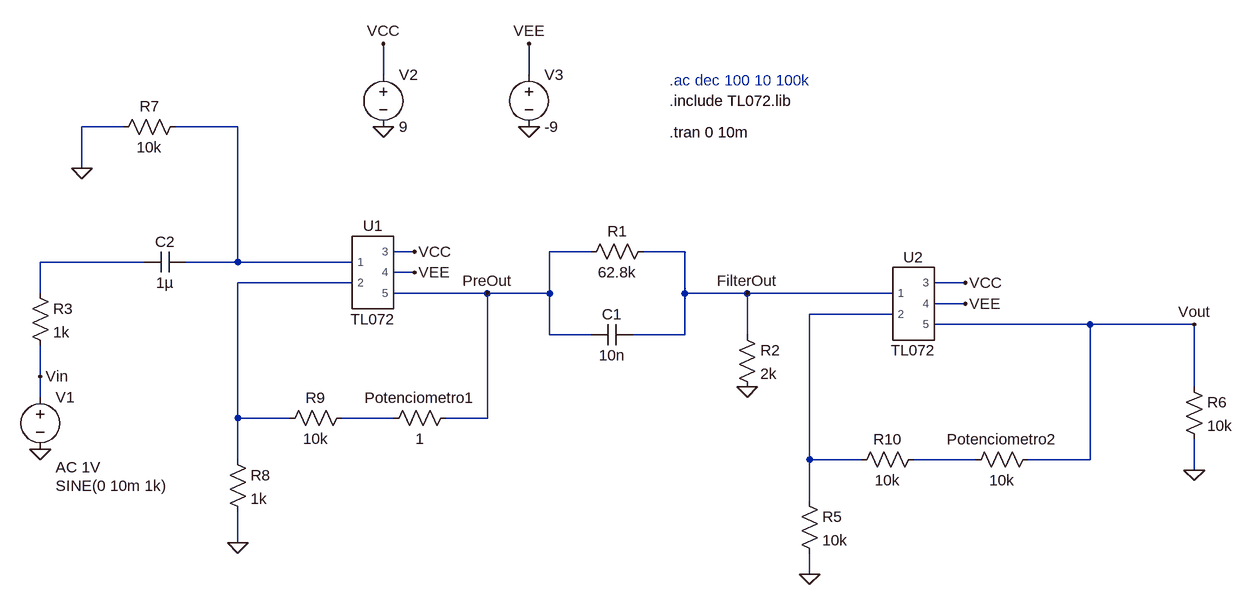
[diagram p0: schematic CircuitoCompleto.asc]
CircuitoCompleto.asc, the LTspice schematic file:
Version 4.1
SHEET 1 1304 808
WIRE -336 -144 -336 -192
WIRE -112 -144 -112 -192
WIRE -736 -64 -800 -64
WIRE -560 -64 -656 -64
WIRE -800 0 -800 -64
WIRE -288 128 -320 128
WIRE -16 128 -80 128
WIRE 128 128 64 128
WIRE -704 144 -864 144
WIRE -560 144 -560 -64
WIRE -560 144 -640 144
WIRE -384 144 -560 144
WIRE -288 160 -320 160
WIRE -384 176 -560 176
WIRE 560 176 512 176
WIRE -864 192 -864 144
WIRE -176 192 -320 192
WIRE -80 192 -80 128
WIRE -80 192 -176 192
WIRE 128 192 128 128
WIRE 224 192 128 192
WIRE 448 192 224 192
WIRE 560 208 512 208
WIRE 448 224 320 224
WIRE 752 240 512 240
WIRE 912 240 752 240
WIRE -80 256 -80 192
WIRE -16 256 -80 256
WIRE 128 256 128 192
WIRE 128 256 48 256
WIRE 224 256 224 192
WIRE -864 320 -864 272
WIRE 912 336 912 240
WIRE -864 352 -864 320
WIRE -560 384 -560 176
WIRE -480 384 -560 384
WIRE -320 384 -400 384
WIRE -176 384 -176 192
WIRE -176 384 -240 384
WIRE -560 448 -560 384
WIRE 320 448 320 224
WIRE 400 448 320 448
WIRE 576 448 480 448
WIRE 752 448 752 240
WIRE 752 448 656 448
WIRE 912 464 912 416
WIRE 320 512 320 448
WIRE -560 576 -560 528
WIRE 320 624 320 592
FLAG 224 336 0
FLAG -864 432 0
FLAG -800 0 0
FLAG -560 576 0
FLAG -176 192 PreOut
FLAG 224 192 FilterOut
FLAG 320 624 0
FLAG 912 464 0
FLAG -336 -64 0
FLAG -112 -64 0
FLAG -336 -192 VCC
FLAG -112 -192 VEE
FLAG -288 128 VCC
FLAG 560 176 VCC
FLAG -288 160 VEE
FLAG 560 208 VEE
FLAG 912 240 Vout
FLAG -864 320 Vin
SYMBOL res 80 112 R90
WINDOW 0 0 56 VBottom 2
WINDOW 3 32 56 VTop 2
SYMATTR InstName R1
SYMATTR Value 62.8k
SYMBOL cap 48 240 R90
WINDOW 0 0 32 VBottom 2
WINDOW 3 32 32 VTop 2
SYMATTR InstName C1
SYMATTR Value 10n
SYMBOL res 208 240 R0
SYMATTR InstName R2
SYMATTR Value 2k
SYMBOL voltage -864 336 R0
WINDOW 3 24 152 Left 2
WINDOW 123 24 124 Left 2
WINDOW 39 0 0 Left 0
SYMATTR Value SINE(0 10m 1k)
SYMATTR Value2 AC 1V
SYMATTR InstName V1
SYMBOL TL072 -352 160 R0
SYMATTR InstName U1
SYMBOL TL072 480 208 R0
SYMATTR InstName U2
SYMBOL cap -640 128 R90
WINDOW 0 0 32 VBottom 2
WINDOW 3 32 32 VTop 2
SYMATTR InstName C2
SYMATTR Value 1µ
SYMBOL res -880 176 R0
SYMATTR InstName R3
SYMATTR Value 1k
SYMBOL res 304 496 R0
SYMATTR InstName R5
SYMATTR Value 10k
SYMBOL res 896 320 R0
SYMATTR InstName R6
SYMATTR Value 10k
SYMBOL res -640 -80 R90
WINDOW 0 0 56 VBottom 2
WINDOW 3 32 56 VTop 2
SYMATTR InstName R7
SYMATTR Value 10k
SYMBOL res -576 432 R0
SYMATTR InstName R8
SYMATTR Value 1k
SYMBOL res -384 368 R90
WINDOW 0 0 56 VBottom 2
WINDOW 3 32 56 VTop 2
SYMATTR InstName R9
SYMATTR Value 10k
SYMBOL res 496 432 R90
WINDOW 0 0 56 VBottom 2
WINDOW 3 32 56 VTop 2
SYMATTR InstName R10
SYMATTR Value 10k
SYMBOL res -224 368 R90
WINDOW 0 0 56 VBottom 2
WINDOW 3 32 56 VTop 2
SYMATTR InstName Potenciometro1
SYMATTR Value 1
SYMBOL res 672 432 R90
WINDOW 0 0 56 VBottom 2
WINDOW 3 32 56 VTop 2
SYMATTR InstName Potenciometro2
SYMATTR Value 10k
SYMBOL voltage -336 -160 R0
WINDOW 123 0 0 Left 0
WINDOW 39 0 0 Left 0
SYMATTR InstName V2
SYMATTR Value 9
SYMBOL voltage -112 -160 R0
WINDOW 123 0 0 Left 0
WINDOW 39 0 0 Left 0
SYMATTR InstName V3
SYMATTR Value -9
TEXT 104 -104 Left 2 !.include TL072.lib
TEXT 104 -136 Left 2 ;.ac dec 100 10 100k
TEXT 104 -56 Left 2 !.tran 0 10m

The netlist it stands for:
* CircuitoCompleto.asc
R1 FilterOut PreOut 62.8k
C1 FilterOut PreOut 10n
R2 FilterOut 0 2k
V1 Vin 0 SINE(0 10m 1k) AC 1V
X§U1 N001 N003 VCC VEE PreOut TL072  ; pins 1 2 3 4 5
X§U2 FilterOut N004 VCC VEE Vout TL072  ; pins 1 2 3 4 5
C2 N001 N002 1µ
R3 N002 Vin 1k
R5 N004 0 10k
R6 Vout 0 10k
R7 N001 0 10k
R8 N003 0 1k
R9 N005 N003 10k
R10 N006 N004 10k
R§Potenciometro1 PreOut N005 1
R§Potenciometro2 Vout N006 10k
V2 VCC 0 9
V3 VEE 0 -9
.include TL072.lib
* .ac dec 100 10 100k
.tran 0 10m
.lib TL072.lib
.backanno
.end